# Altium schematic sheet Controller_Fuses_Sheet.SchDoc
size 420 x 297 mm; SheetNumber: 5; SheetTotal: 5
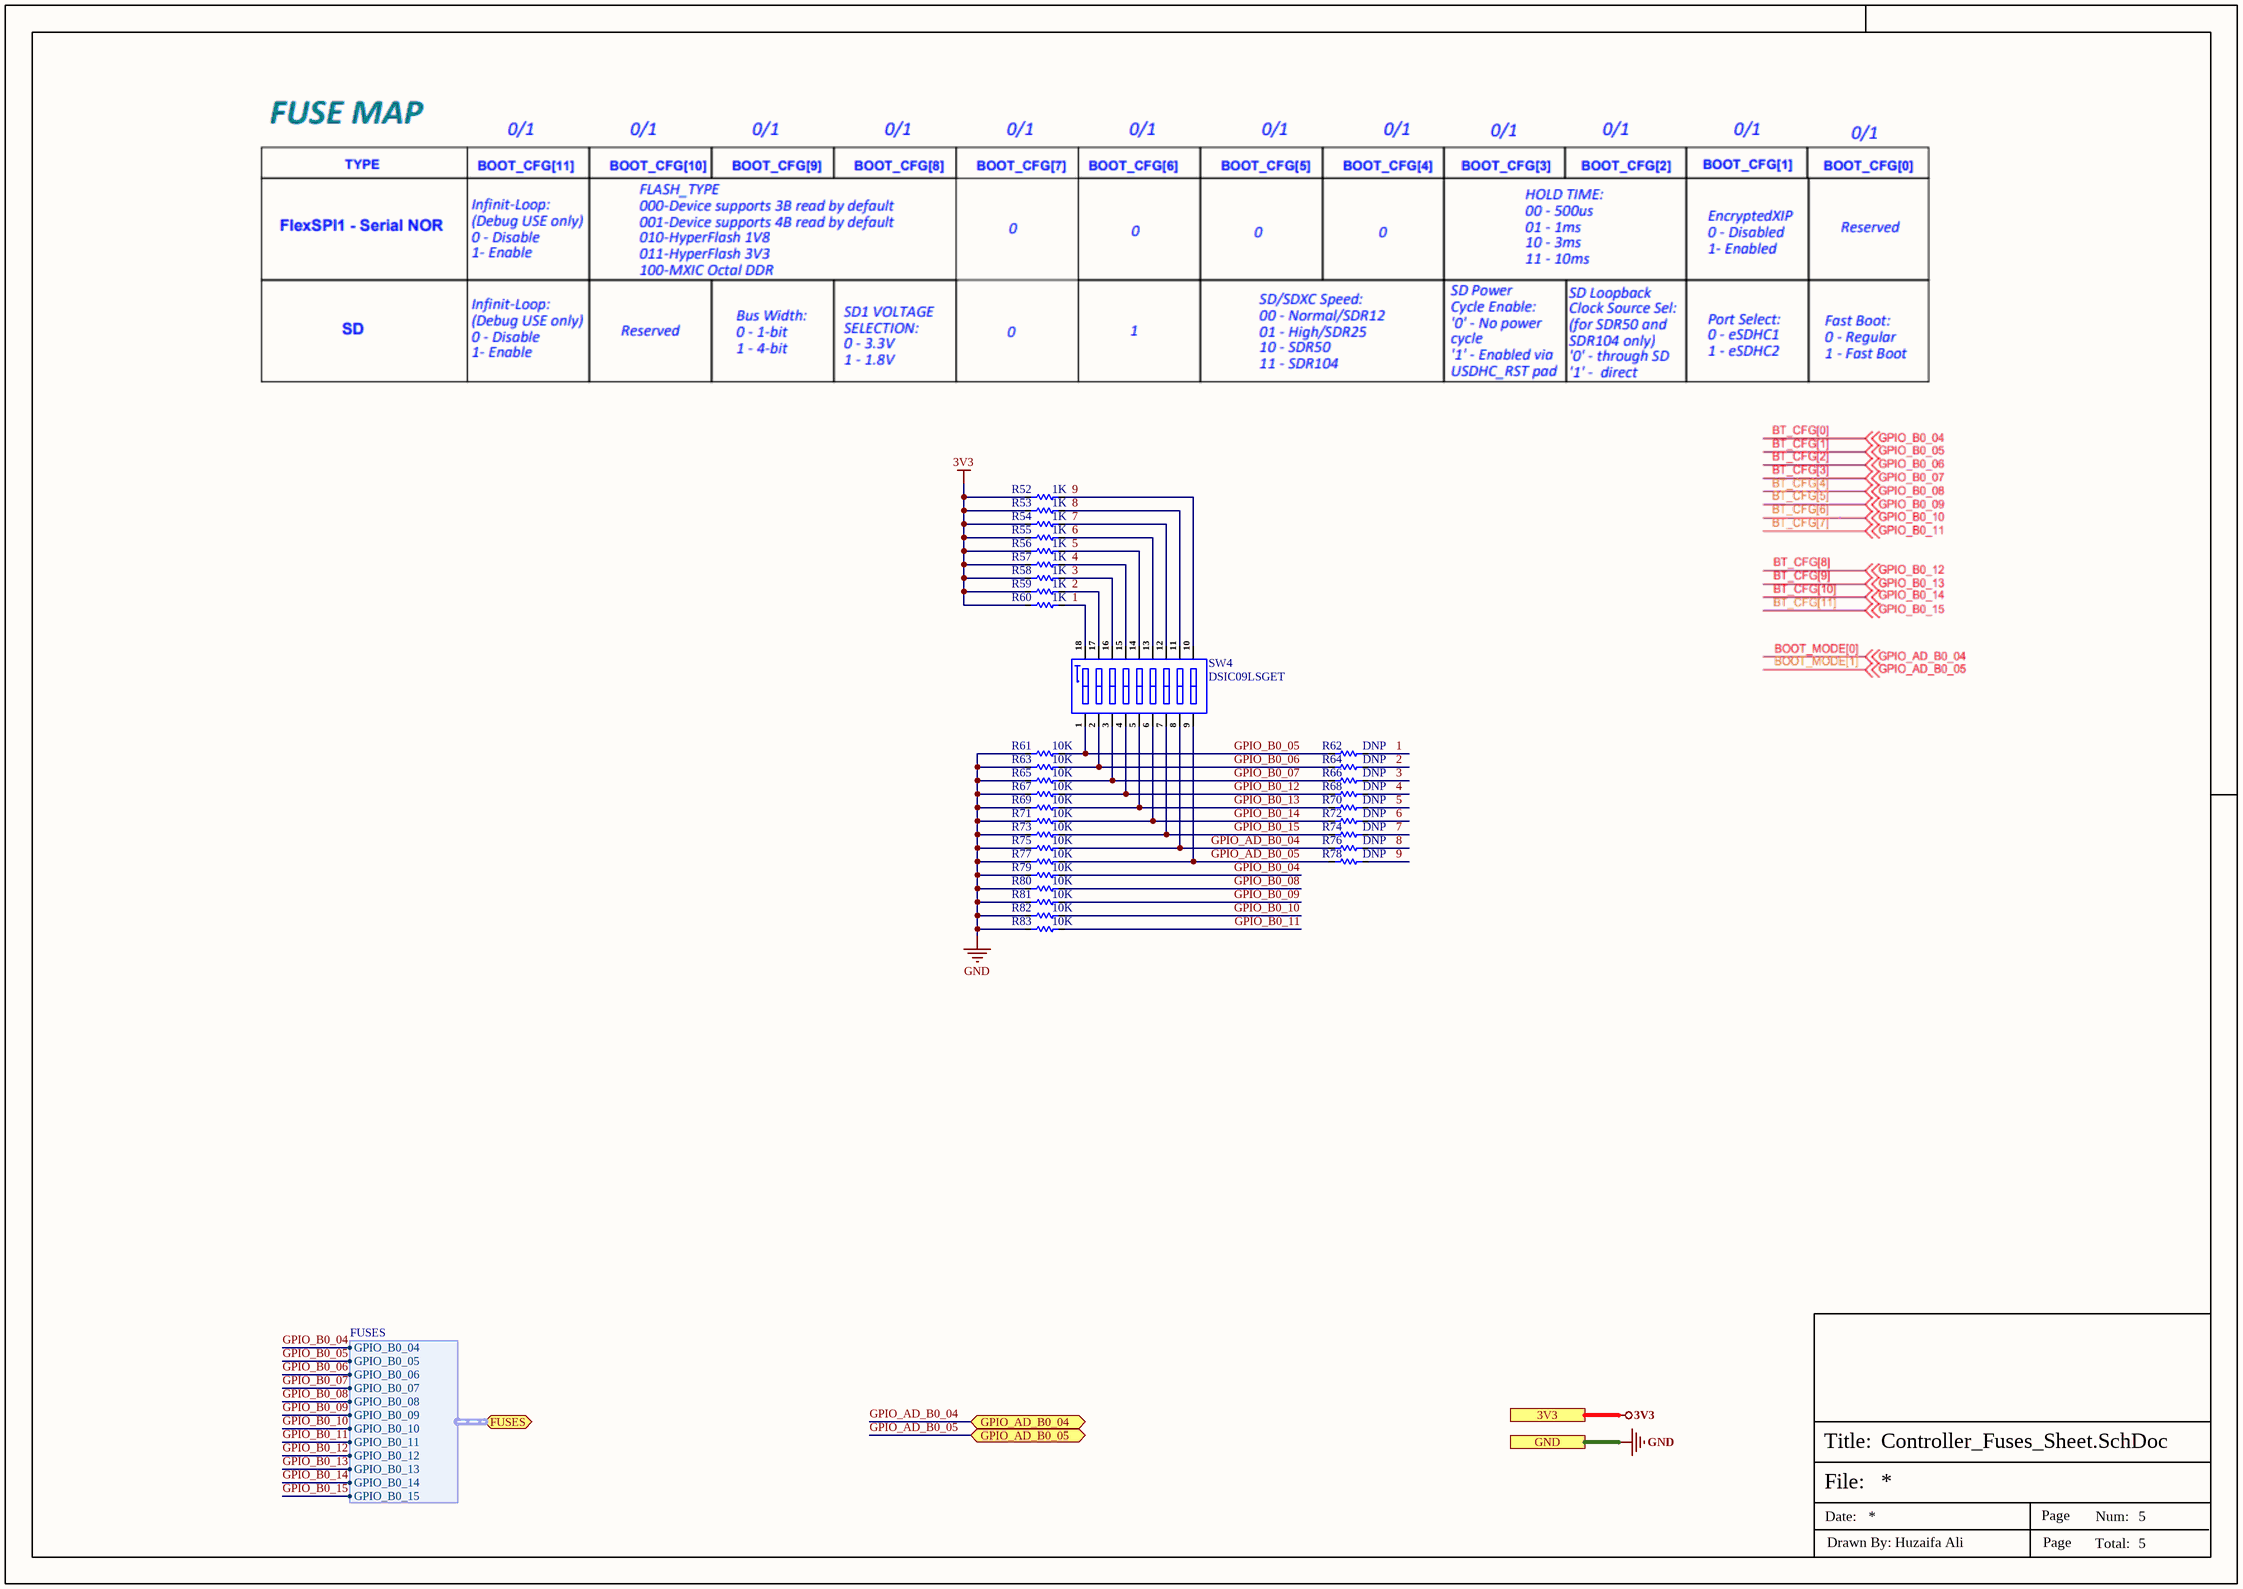
[diagram p0: Controller_Fuses_Sheet.SchDoc]

## Parts
R52  1K  [Res-0603]
R53  1K  [Res-0603]
R54  1K  [Res-0603]
R55  1K  [Res-0603]
R56  1K  [Res-0603]
R57  1K  [Res-0603]
R58  1K  [Res-0603]
R59  1K  [Res-0603]
R60  1K  [Res-0603]
R61  10K  [Res-0402]
R62  DNP  [Res-0402]
R63  10K  [Res-0402]
R64  DNP  [Res-0402]
R65  10K  [Res-0402]
R66  DNP  [Res-0402]
R67  10K  [Res-0402]
R68  DNP  [Res-0402]
R69  10K  [Res-0402]
R70  DNP  [Res-0402]
R71  10K  [Res-0402]
R72  DNP  [Res-0402]
R73  10K  [Res-0402]
R74  DNP  [Res-0402]
R75  10K  [Res-0402]
R76  DNP  [Res-0402]
R77  10K  [Res-0402]
R78  DNP  [Res-0402]
R79  10K  [Res-0402]
R80  10K  [Res-0402]
R81  10K  [Res-0402]
R82  10K  [Res-0402]
R83  10K  [Res-0402]
SW4  DSIC09LSGET  [DSIC09LSGET]

## Ports
3V3, FUSES (bidir, harness FUSES), GND, GPIO_AD_B0_04 (bidir), GPIO_AD_B0_05 (bidir)

## Harnesses
FUSES: GPIO_B0_04, GPIO_B0_05, GPIO_B0_06, GPIO_B0_07, GPIO_B0_08, GPIO_B0_09, GPIO_B0_10, GPIO_B0_11, GPIO_B0_12, GPIO_B0_13, GPIO_B0_14, GPIO_B0_15

## Nets
3V3: R52.2 R53.2 R54.2 R55.2 R56.2 R57.2 R58.2 R59.2 R60.2 ; port 3V3
GND: R61.1 R63.1 R65.1 R67.1 R69.1 R71.1 R73.1 R75.1 R77.1 R79.1 R80.1 R81.1 R82.1 R83.1 ; port GND
1: R60.1 R62.2 SW4.18(B1)
2: R59.1 R64.2 SW4.17(B2)
3: R58.1 R66.2 SW4.16(B3)
4: R57.1 R68.2 SW4.15(B4)
5: R56.1 R70.2 SW4.14(B5)
6: R55.1 R72.2 SW4.13(B6)
7: R54.1 R74.2 SW4.12(B7)
8: R53.1 R76.2 SW4.11(B8)
9: R52.1 R78.2 SW4.10(B9)
GPIO_AD_B0_04: R75.2 R76.1 SW4.8(A8) ; port GPIO_AD_B0_04
GPIO_AD_B0_05: R77.2 R78.1 SW4.9(A9) ; port GPIO_AD_B0_05
GPIO_B0_04: R79.2 ; port FUSES.GPIO_B0_04
GPIO_B0_05: R61.2 R62.1 SW4.1(A1) ; port FUSES.GPIO_B0_05
GPIO_B0_06: R63.2 R64.1 SW4.2(A2) ; port FUSES.GPIO_B0_06
GPIO_B0_07: R65.2 R66.1 SW4.3(A3) ; port FUSES.GPIO_B0_07
GPIO_B0_08: R80.2 ; port FUSES.GPIO_B0_08
GPIO_B0_09: R81.2 ; port FUSES.GPIO_B0_09
GPIO_B0_10: R82.2 ; port FUSES.GPIO_B0_10
GPIO_B0_11: R83.2 ; port FUSES.GPIO_B0_11
GPIO_B0_12: R67.2 R68.1 SW4.4(A4) ; port FUSES.GPIO_B0_12
GPIO_B0_13: R69.2 R70.1 SW4.5(A5) ; port FUSES.GPIO_B0_13
GPIO_B0_14: R71.2 R72.1 SW4.6(A6) ; port FUSES.GPIO_B0_14
GPIO_B0_15: R73.2 R74.1 SW4.7(A7) ; port FUSES.GPIO_B0_15

## Notes on the sheet
- File:
- Title:
- Date:
- Page
- Num:
- Total:
- Drawn By: Huzaifa Ali

## Library data of the parts
R52-R60 = RC0603FR-071KL: RES SMD 1K OHM 1% 1/10W 0603; Manufacturer: Yageo; Resistance: 1kR; Temperature Coefficient: 100ppm/°C; Power Rating: 100mW; Voltage Rating: 50V; Item type: Resistor; ComponentLink1URL: https://www.verical.com/server-webapp/html/getDatasheet?partID=409289&src-supplier=Verical; ComponentLink1Description: https://www.verical.com/server-webapp/html/getDatasheet?partID=409289&src-supplier=Verical; Supplier 1: Digi-Key; Manufacturer Part Number: RC0603FR-071KL; Stock 1: 21472395; Pricing 1: 1=0.1, 10=0.023, 100=0.0094, 1000=0.0042, 2500=0.0037 (USD); Case/Package: 0603; Contact Plating: Tin,Matte; Case Code (Imperial): 0603; Case Code (Metric): 1608; Min Operating Temperature: -55°C; Max Operating Temperature: 155°C; Tolerance: 1%; Composition: Thick Film; Packaging: Tape and Reel; Termination: SMD/SMT; Military Standard: Not; Length: 1.6mm; Height: 0.45mm; Depth: 0.8mm; Radiation Hardening: No; REACH SVHC: No SVHC; Lead Free: Lead Free; ComponentLink2URL: http://documents.rs-components.com/techlib://itc_doclist_GB.htm?stockno=5048928&src-supplier=RSComponents; ComponentLink2Description: http://documents.rs-components.com/techlib://itc_doclist_GB.htm?stockno=5048928&src-supplier=RSComponents; ComponentLink3URL: http://www.yageo.com/documents/recent/PYu-RC0603_51_RoHS_L_4.pdf?src-supplier=Avnet+Europe; ComponentLink3Description: http://www.yageo.com/documents/recent/PYu-RC0603_51_RoHS_L_4.pdf?src-supplier=Avnet+Europe; ComponentLink4URL: http://www.farnell.com/datasheets/2167052.pdf?src-supplier=Element14; ComponentLink4Description: http://www.farnell.com/datasheets/2167052.pdf?src-supplier=Element14; ComponentLink5URL: http://www.farnell.com/datasheets/1868787.pdf?src-supplier=Element14; ComponentLink5Description: http://www.farnell.com/datasheets/1868787.pdf?src-supplier=Element14; ComponentLink6URL: http://www.yageo.com/documents/recent/PYu-RC_Group_51_RoHS_L_2.pdf?src-supplier=Avnet; ComponentLink6Description: http://www.yageo.com/documents/recent/PYu-RC_Group_51_RoHS_L_2.pdf?src-supplier=Avnet; ComponentLink7URL: https://www.verical.com/server-webapp/html/getDatasheet?partID=404327&src-supplier=Verical; ComponentLink7Description: https://www.verical.com/server-webapp/html/getDatasheet?partID=404327&src-supplier=Verical; ComponentLink8URL: http://www.farnell.com/datasheets/443971.pdf?src-supplier=Element14; ComponentLink8Description: http://www.farnell.com/datasheets/443971.pdf?src-supplier=Element14; Supplier Part Number 1: 311-1.00KHRDKR-ND; LCSC Part Number: C22548
R61 R63 R65 R67 R69 R71 R73 R75 R77 R79-R83 = RC0402FR-0710KL: RES 10K OHM 1% 1/16W 0402; Manufacturer: Yageo; Resistance: 10kR; Voltage Rating (DC): 50V; Temperature Coefficient: 100ppm/°C; Power Rating: 62.5mW; Max Power Dissipation: 63mW; Item Type: Resistor; Supplier 1: Mouser; Manufacturer Part Number: RC0402FR-0710KL; RoHS: Yes; Category: Chip SMD Resistors; Stock 1: 18648329; Pricing 1: 1=0.10000, 10=0.01400, 50=0.01400, 100=0.00500, 1000=0.00300, 10000=0.00200 (USD); Case/Package: 0402; Number of Pins: 2; Case Code (Imperial): 0402; Case Code (Metric): 1005; Min Operating Temperature: -55°C; Max Operating Temperature: 155°C; Resistor Type: Thick Film; Tolerance: 1%; Packaging: Tape and Reel; Voltage Rating: 50V; Termination: SMD/SMT; Working Voltage: 50V; Number of Terminations: 2; Features: Moisture Resistant; Series: RC; Resistance Tolerance: 1%; Construction: Rectangular; Length: 1mm; Width: 0.5mm; Height: 0.32mm; Depth: 0.5mm; Lead Pitch: 0.2mm; REACH SVHC: No SVHC; Lead Free: Lead Free; RoHS Compliant: Yes; Military Standard: Not; ComponentLink1URL: https://datasheet.ciiva.com/7660/38568-7660787.pdf?src-supplier=Element14; ComponentLink1Description: https://datasheet.ciiva.com/7660/38568-7660787.pdf?src-supplier=Element14; ComponentLink2URL: https://datasheet.ciiva.com/7849/1686128-7849814.pdf?src-supplier=Element14; ComponentLink2Description: https://datasheet.ciiva.com/7849/1686128-7849814.pdf?src-supplier=Element14; ComponentLink3URL: https://datasheet.ciiva.com/7983/1018594-7983486.pdf?src-supplier=Element14; ComponentLink3Description: https://datasheet.ciiva.com/7983/1018594-7983486.pdf?src-supplier=Element14; ComponentLink4URL: https://datasheet.ciiva.com/22747/1018594-22747512.pdf?src-supplier=Element14; ComponentLink4Description: https://datasheet.ciiva.com/22747/1018594-22747512.pdf?src-supplier=Element14; ComponentLink5URL: https://datasheet.ciiva.com/12667/pyu-rc0402-51-rohs-l-6-r-12667067.pdf?src-supplier=Mouser; ComponentLink5Description: https://datasheet.ciiva.com/12667/pyu-rc0402-51-rohs-l-6-r-12667067.pdf?src-supplier=Mouser; ComponentLink6URL: https://datasheet.ciiva.com/7849/1784430-7849813.pdf?src-supplier=Element14; ComponentLink6Description: https://datasheet.ciiva.com/7849/1784430-7849813.pdf?src-supplier=Element14; ComponentLink7URL: https://datasheet.ciiva.com/7849/1784430-7849815.pdf?src-supplier=Element14; ComponentLink7Description: https://datasheet.ciiva.com/7849/1784430-7849815.pdf?src-supplier=Element14; Supplier Part Number 1: 603-RC0402FR-0710KL; LCSC Part Number: C60490
R62 R64 R66 R68 R70 R72 R74 R76 R78 = RC0402FR-070RL: RES 0 OHM JUMPER 1/16W 0402; Manufacturer: Yageo; Item Type: Resistors; Resistance: 0R; Tolerance: 1%; Power Rating: 62.5mW; Voltage Rating: 50V; Temperature Coefficient: 200ppm/°C; Max Power Dissipation: 63mW; Supplier 1: Mouser; Manufacturer Part Number: RC0402FR-070RL; RoHS: Yes; Stock 1: 8556842; Pricing 1: 1=0.10000, 10=0.01400, 50=0.01400, 100=0.00600, 1000=0.00300, 5000=0.00200, 10000=0.00100 (USD); Mount: Surface Mount; Case/Package: 0402; Contact Plating: Tin,Matte; Case Code (Imperial): 0402; Case Code (Metric): 1005; Size Code: 0402; Min Operating Temperature: -55°C; Max Operating Temperature: 155°C; Resistor Type: Thick Film; Packaging: Tape and Reel; Termination: SMD/SMT; Features: Moisture Resistant; Series: RC; Number of Terminations: 2; Length: 1mm; Width: 0.5mm; Height: 0.35mm; Radiation Hardening: No; Lead Free: Lead Free; RoHS Compliant: Yes; ComponentLink1URL: https://datasheet.ciiva.com/8896/pyu-rc0402-51-rohs-l-6-8896149.pdf?src-supplier=Avnet; ComponentLink1Description: https://datasheet.ciiva.com/8896/pyu-rc0402-51-rohs-l-6-8896149.pdf?src-supplier=Avnet; ComponentLink2URL: https://datasheet.ciiva.com/16790/pyu-rc0402-51-rohs-l-6-r-16790444.pdf?src-supplier=Future+Electronics; ComponentLink2Description: https://datasheet.ciiva.com/16790/pyu-rc0402-51-rohs-l-6-r-16790444.pdf?src-supplier=Future+Electronics; Supplier Part Number 1: 603-RC0402FR-070RL; LCSC Part Number: C106231
SW4 = DSIC09LSGET: 9Bit SPST Black Slide (Standard),凸起式 SMD-18P,6x22.9mm DIP Switches ROHS; Manufacturer: DongGuan; Manufacturer Part Number: DSIC09LSGET; Package: SMD-18P,6x22.9mm; LCSC Part Number: C57455; Item Type: DIP Switche; ComponentLink1Description: LCSC; ComponentLink1URL: https://www.lcsc.com/product-detail/DIP-Switches_DongGuan-KINGTEK-Industrial-Co-LTD-DSIC09LSGET_C57455.html